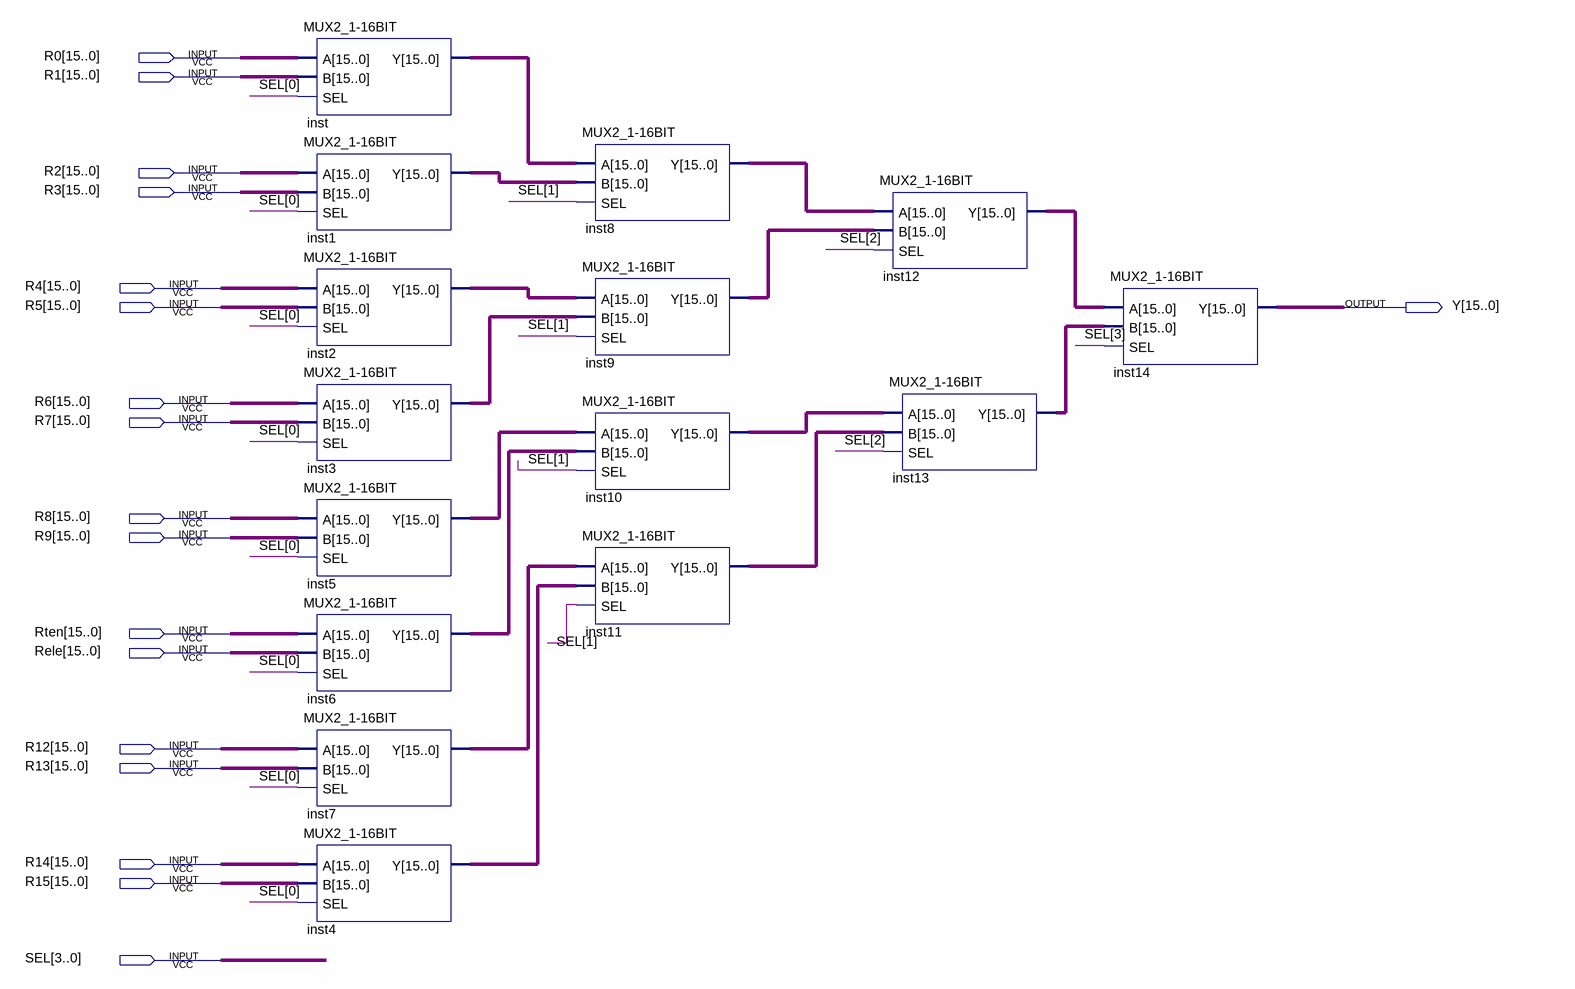
[diagram p0: schematic sheet]
// Quartus schematic MUX16to1.bdf as structural Verilog: 15 symbols, 18 pins
module MUX16to1 (
  input  [15:0] R0,
  input  [15:0] R1,
  input  [15:0] R2,
  input  [15:0] R3,
  input  [15:0] R4,
  input  [15:0] R5,
  input  [15:0] R6,
  input  [15:0] R7,
  input  [15:0] R8,
  input  [15:0] R9,
  input  [15:0] Rten,
  input  [15:0] Rele,
  input  [15:0] R12,
  input  [15:0] R13,
  input  [15:0] R14,
  input  [15:0] R15,
  input  [3:0] SEL,
  output [15:0] Y
);

  wire [15:0] inst1_y, inst2_y, inst3_y, inst4_y, inst5_y, inst6_y, inst7_y, inst8_y, inst9_y, inst10_y,
       inst11_y, inst12_y, inst13_y, inst_y;

  \MUX2_1-16BIT  inst (.A(R0), .B(R1), .SEL(SEL[0]), .Y(inst_y));
  \MUX2_1-16BIT  inst1 (.A(R2), .B(R3), .SEL(SEL[0]), .Y(inst1_y));
  \MUX2_1-16BIT  inst2 (.A(R4), .B(R5), .SEL(SEL[0]), .Y(inst2_y));
  \MUX2_1-16BIT  inst3 (.A(R6), .B(R7), .SEL(SEL[0]), .Y(inst3_y));
  \MUX2_1-16BIT  inst5 (.A(R8), .B(R9), .SEL(SEL[0]), .Y(inst5_y));
  \MUX2_1-16BIT  inst6 (.A(Rten), .B(Rele), .SEL(SEL[0]), .Y(inst6_y));
  \MUX2_1-16BIT  inst7 (.A(R12), .B(R13), .SEL(SEL[0]), .Y(inst7_y));
  \MUX2_1-16BIT  inst4 (.A(R14), .B(R15), .SEL(SEL[0]), .Y(inst4_y));
  \MUX2_1-16BIT  inst8 (.A(inst_y), .B(inst1_y), .SEL(SEL[1]), .Y(inst8_y));
  \MUX2_1-16BIT  inst9 (.A(inst2_y), .B(inst3_y), .SEL(SEL[1]), .Y(inst9_y));
  \MUX2_1-16BIT  inst10 (.A(inst5_y), .B(inst6_y), .SEL(SEL[1]), .Y(inst10_y));
  \MUX2_1-16BIT  inst11 (.A(inst7_y), .B(inst4_y), .SEL(SEL[1]), .Y(inst11_y));
  \MUX2_1-16BIT  inst12 (.A(inst8_y), .B(inst9_y), .SEL(SEL[2]), .Y(inst12_y));
  \MUX2_1-16BIT  inst13 (.A(inst10_y), .B(inst11_y), .SEL(SEL[2]), .Y(inst13_y));
  \MUX2_1-16BIT  inst14 (.A(inst12_y), .B(inst13_y), .SEL(SEL[3]), .Y(Y));
endmodule
